# Altium schematic sheet TFT_Display_Sheet.SchDoc
size 420 x 297 mm; SheetNumber: 6; SheetTotal: 9
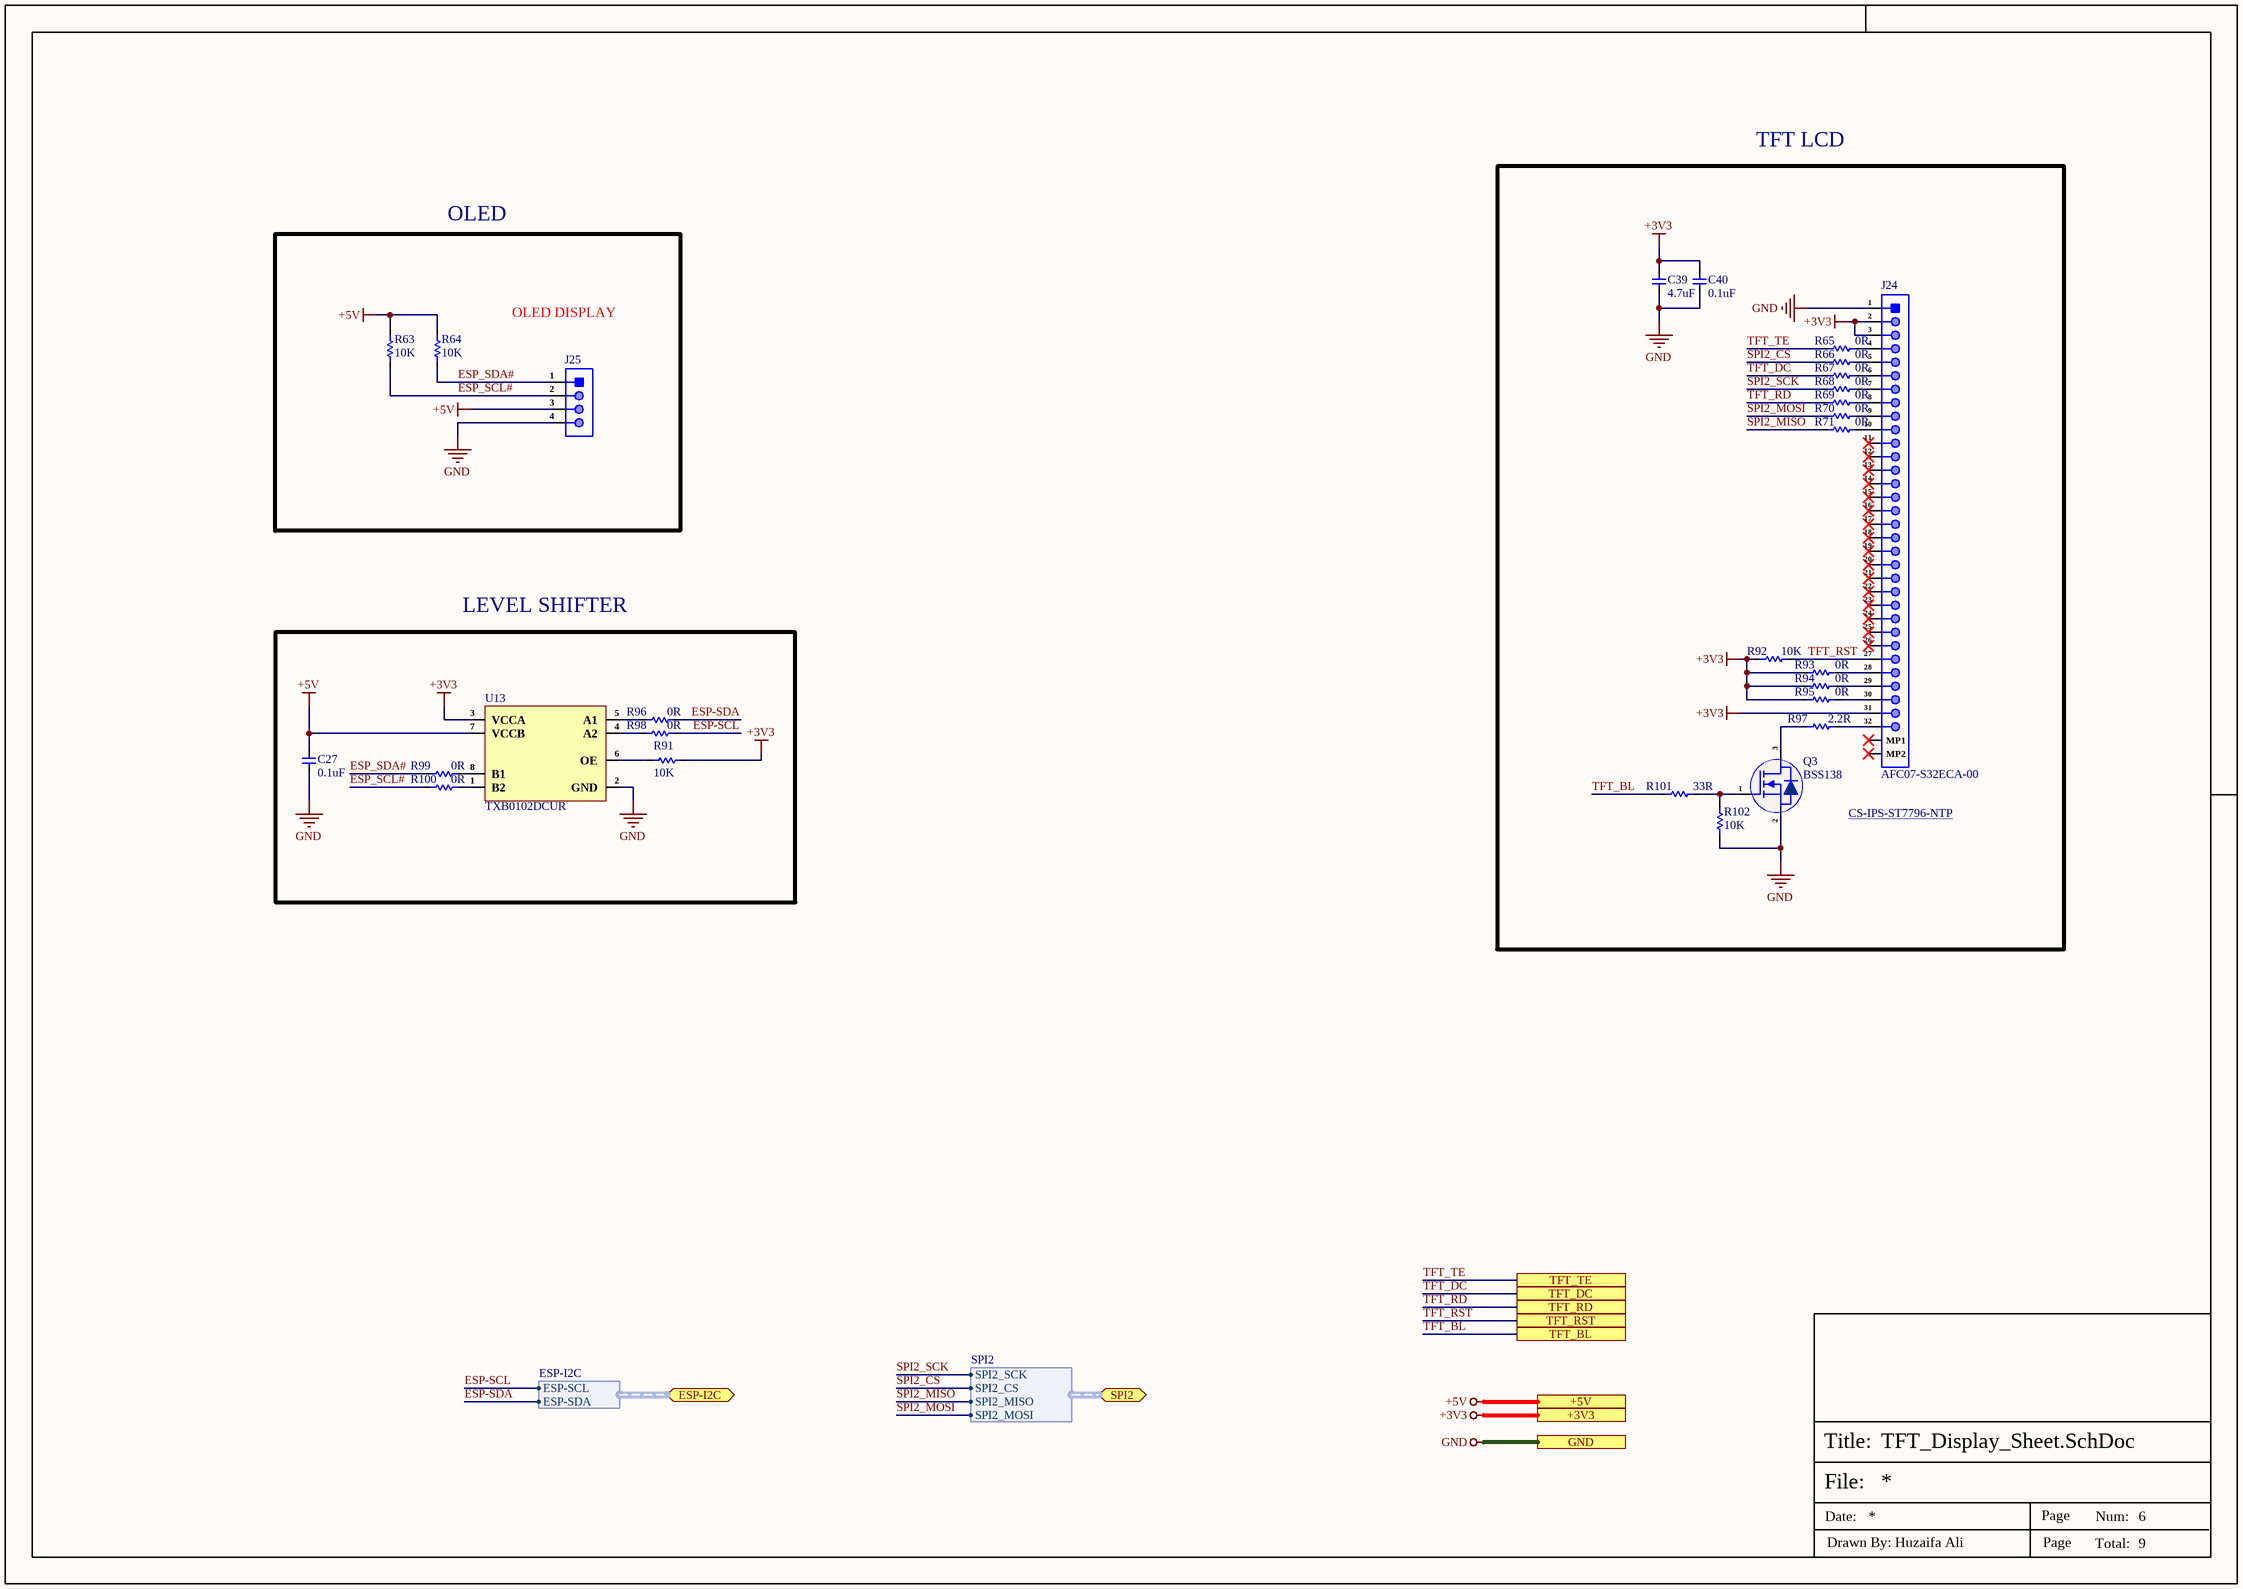
[diagram p0: TFT_Display_Sheet.SchDoc]

## Parts
C27  0.1uF  [Cap-0402]
C39  4.7uF  [Cap-0603]
C40  0.1uF  [Cap-0402]
J24  AFC07-S32ECA-00  [AFC07-S32ECA-00]
J25  B4B-XH-A(LF)(SN)  [B4B-XH-A(LF)(SN).]  (value not drawn)
Q3  BSS138  [Sot-23]
R63  10K  [Res-0402]
R64  10K  [Res-0402]
R65  0R  [Res-0402]
R66  0R  [Res-0402]
R67  0R  [Res-0402]
R68  0R  [Res-0402]
R69  0R  [Res-0402]
R70  0R  [Res-0402]
R71  0R  [Res-0402]
R91  10K  [Res-0402]
R92  10K  [Res-0402]
R93  0R  [Res-0402]
R94  0R  [Res-0402]
R95  0R  [Res-0402]
R96  0R  [Res-0402]
R97  2.2R  [Res-0603]
R98  0R  [Res-0402]
R99  0R  [Res-0402]
R100  0R  [Res-0402]
R101  33R  [Res-0402]
R102  10K  [Res-0402]
U13  TXB0102DCUR  [VSSOP-8(3.1x2.1)]

## Blocks framed on the sheet
CS-IPS-ST7796-NTP: C39 C40 J24 Q3 R65-R71 R92-R95 R97 R101 R102
OLED DISPLAY: J25 R63 R64

## Ports
+3V3 (see Top-Sheet[2B], CAN_Sheet[5D], ESP32_Sheet[5D], EtherCAT_Sheet[5D], Ethernet_Sheet[5D], Power_Sheet[5D], RS485_RS232_Sheet[5D], STM32_Sheet[5D]), +5V (see Top-Sheet[2B], CAN_Sheet[5D], Power_Sheet[5D], STM32_Sheet[5D]), ESP-I2C (bidir, harness ESP-I2C, see Top-Sheet[2B], ESP32_Sheet[4D]), GND (see Top-Sheet[2B], CAN_Sheet[5D], ESP32_Sheet[5D], EtherCAT_Sheet[5D], Ethernet_Sheet[5D], Power_Sheet[5D], RS485_RS232_Sheet[5D], STM32_Sheet[5D]), SPI2 (bidir, harness SPI2, see Top-Sheet[2B], STM32_Sheet[1C]), TFT_BL (see Top-Sheet[2C], STM32_Sheet[3D]), TFT_DC (see Top-Sheet[2C], STM32_Sheet[4D]), TFT_RD (see Top-Sheet[2C], STM32_Sheet[4D]), TFT_RST (see Top-Sheet[2C], STM32_Sheet[4D]), TFT_TE (see Top-Sheet[2B], STM32_Sheet[4D])

## Harnesses
ESP-I2C: ESP-SCL, ESP-SDA
SPI2: SPI2_SCK, SPI2_CS, SPI2_MISO, SPI2_MOSI

## Nets
+3V3: C39.2 C40.2 J24.2 J24.3 J24.31 R91.2 R92.2 R93.1 R94.1 R95.1 U13.3(VCCA) ; port +3V3
+5V: C27.2 J25.3 R63.2 R64.2 U13.7(VCCB) ; port +5V
GND: C27.1 C39.1 C40.1 J24.1 J25.4 Q3.2(S) R102.2 U13.2(GND) ; port GND
ESP-SCL: R98.2 ; port ESP-I2C.ESP-SCL
ESP-SDA: R96.2 ; port ESP-I2C.ESP-SDA
ESP_SCL#: J25.2 R63.1 R100.1
ESP_SDA#: J25.1 R64.1 R99.1
SPI2_CS: R66.1 ; port SPI2.SPI2_CS
SPI2_MISO: R71.1 ; port SPI2.SPI2_MISO
SPI2_MOSI: R70.1 ; port SPI2.SPI2_MOSI
SPI2_SCK: R68.1 ; port SPI2.SPI2_SCK
TFT_BL: R101.1 ; port TFT_BL
TFT_DC: R67.1 ; port TFT_DC
TFT_RD: R69.1 ; port TFT_RD
TFT_RST: J24.27 R92.1 ; port TFT_RST
TFT_TE: R65.1 ; port TFT_TE
NetJ24_4: J24.4 R65.2
NetJ24_5: J24.5 R66.2
NetJ24_6: J24.6 R67.2
NetJ24_7: J24.7 R68.2
NetJ24_8: J24.8 R69.2
NetJ24_9: J24.9 R70.2
NetJ24_10: J24.10 R71.2
NetJ24_28: J24.28 R93.2
NetJ24_29: J24.29 R94.2
NetJ24_30: J24.30 R95.2
NetJ24_32: J24.32 R97.2
NetQ3_1: Q3.1(G) R101.2 R102.1
NetQ3_3: Q3.3(D) R97.1
NetR91_1: R91.1 U13.6(OE)
NetR96_1: R96.1 U13.5(A1)
NetR98_1: R98.1 U13.4(A2)
NetR99_2: R99.2 U13.8(B1)
NetR100_2: R100.2 U13.1(B2)

Not connected (* = marked no-connect by the designer): J24 11* 12* 13* 14* 15* 16* 17* 18* 19* 20* 21* 22* 23* 24* 25* 26* MP1* MP2*

## Notes on the sheet
- TFT LCD
- OLED
- LEVEL SHIFTER
- File:
- Title:
- Date:
- Page
- Num:
- Total:
- Drawn By: Huzaifa Ali

## Library data of the parts
C27 = C1005X5R1H104K050BB: CAP CER 0.1UF 50V X5R 0402; Manufacturer: TDK; Dielectric Material: Ceramic; Capacitance: 100nF; Tolerance: 10%; Item Type: Capacitor; Supplier 1: Digi-Key; Manufacturer Part Number: C1005X5R1H104K050BB; Stock 1: 1455182; Pricing 1: 1=0.12, 10=0.09, 50=0.049, 100=0.04, 500=0.02858, 1000=0.02245, 2500=0.02041, 5000=0.01878 (USD); Mount: Surface Mount; Case/Package: 0402; Case Code (Metric): 1005; Case Code (Imperial): 0402; Weight: 2.3E-05oz; Min Operating Temperature: -55°C; Max Operating Temperature: 85°C; Dielectric: X5R; Voltage Rating: 50V; Packaging: Tape and Reel; Voltage Rating (DC): 50V; Termination: SMD/SMT; Construction: Flat; Package Quantity: 1; Resistor Type: Ceramic; Voltage: 50V; Series: C; Length: 1mm; Width: 0.02inch; Height: 0.5mm; Depth: 0.5mm; Thickness: 0.022inch; Radiation Hardening: No; Lead Free: Lead Free; REACH SVHC: No SVHC; RoHS Compliant: Yes; ComponentLink1URL: https://product.tdk.com/info/en/catalog/spec/mlccspec_commercial_general_midvoltage_en.pdf?src-supplier=Digi-Key; ComponentLink1Description: https://product.tdk.com/info/en/catalog/spec/mlccspec_commercial_general_midvoltage_en.pdf?src-supplier=Digi-Key; ComponentLink2URL: http://www.tdk.co.jp/tefe02/e413_c.pdf?src-supplier=Future+Electronics; ComponentLink2Description: http://www.tdk.co.jp/tefe02/e413_c.pdf?src-supplier=Future+Electronics; ComponentLink3URL: https://www.verical.com/server-webapp/html/getDatasheet?partID=743571&src-supplier=Verical; ComponentLink3Description: https://www.verical.com/server-webapp/html/getDatasheet?partID=743571&src-supplier=Verical; ComponentLink4URL: http://www.tdk.co.jp/tefe02/e412_c.pdf?src-supplier=Avnet+Europe; ComponentLink4Description: http://www.tdk.co.jp/tefe02/e412_c.pdf?src-supplier=Avnet+Europe; Supplier Part Number 1: 445-5942-1-ND; LCSC Part Number: C2181865
C39 = CC0603KRX5R7BB475: CAP CER 4.7UF 16V X5R 0603; Manufacturer: Yageo; Tolerance: 10%; Item Type: Capacitor; Supplier 1: Digi-Key; Manufacturer Part Number: CC0603KRX5R7BB475; RoHS: Yes; Category: Ceramic Capacitors; Stock 1: 547703; Pricing 1: 1=0.20000, 10=0.13800, 50=0.08280, 100=0.06990, 500=0.04784, 1000=0.04233 (USD); Mount: Surface Mount; Case/Package: 0603; Case Code (Imperial): 0603; Case Code (Metric): 1608; Weight: 7.1E-05oz; Min Operating Temperature: -55°C; Max Operating Temperature: 85°C; Capacitance: 4.7uF; Voltage Rating: 16V; Voltage Rating (DC): 16V; Packaging: Tape and Reel; Dielectric: X5R; Termination: SMD/SMT; Resistor Type: Ceramic; Series: CC; Length: 1.6mm; Width: 0.8mm; Height: 0.8mm; Thickness: 0.037inch; Depth: 0.8mm; Lead Free: Lead Free; Halogen Free: Halogen Free; RoHS Compliant: Yes; ComponentLink1URL: http://www.mouser.com/ds/2/447/UPY-GPHC_X5R_4V-to-50V_25-1131599.pdf?src-supplier=Mouser; ComponentLink1Description: http://www.mouser.com/ds/2/447/UPY-GPHC_X5R_4V-to-50V_25-1131599.pdf?src-supplier=Mouser; ComponentLink2URL: http://www.yageo.com/documents/recent/UPY-GPHC_X5R_4V-to-50V_25.pdf?src-supplier=Digi-Key; ComponentLink2Description: http://www.yageo.com/documents/recent/UPY-GPHC_X5R_4V-to-50V_25.pdf?src-supplier=Digi-Key; Supplier Part Number 1: 311-1785-1-ND; LCSC Part Number: C277476
C40 = CC0402JRX7R7BB104: CAP CER 0.1UF 16V X7R 0402; Manufacturer: Yageo; Material: 4241ConductorMaterial; Value: 100nF; Tolerance: 5%; Item Type: Capacitor; Supplier: Digikey; Supplier Part Number: 311-1676-1-ND; Manufacturer Part Number: CC0402JRX7R7BB104; RoHS: Yes; Category: Ceramic Capacitors; Stock: 1659111; Pricing: 1=0.1, 10=0.046, 50=0.0262, 100=0.0203, 500=0.01528, 1000=0.012, 2500=0.01091, 5000=0.01004 (USD); Mounting Technology: Surface Mount; Case/Package: 0402; Case Code (Metric): 1005; Case Code (Imperial): 0402; Min Operating Temperature: -55°C; Max Operating Temperature: 125°C; Dielectric: X7R; Packaging: Tape and Reel; Package Quantity: 10000; Voltage Rating (DC): 16V; Voltage Rating: 16V; Series: CC; Construction: Flat; Length: 0.039inch; Width: 0.02inch; Height: 0.5mm; Thickness: 0.022inch; Lead Free: Lead Free; Halogen Free: Halogen Free; RoHS Compliant: Yes; ComponentLink1URL: https://datasheet.ciiva.com/13210/upy-gphc-x7r-6-3v-to-50v-8-12304-13210152.pdf?src-supplier=Mouser; ComponentLink1Description: https://datasheet.ciiva.com/13210/upy-gphc-x7r-6-3v-to-50v-8-12304-13210152.pdf?src-supplier=Mouser; LCSC Part Number: C541464
J24 = AFC07-S32ECA-00: Slide Lock 32P Contact,Top Surface Mount，Right Angle 0.5mm SMD,P=0.5mm,Surface Mount，Right Angle FFC/FPC Connectors ROHS; Manufacturer: JUSHUO; Manufacturer Part Number: AFC07-S32ECA-00; Package: Custom; LCSC Part Number: C262646; Item Type: FFC/FPC Connector; ComponentLink1Description: LCSC; ComponentLink1URL: https://www.lcsc.com/product-detail/FFC-FPC-Connectors_JUSHUO-AFC07-S32ECA-00_C262646.html
J25 = B4B-XH-A(LF)(SN): CONN HEADER VERT 4POS 2.5MM; Manufacturer: JST; Current Rating: 3A; Gender: Male; Contact Resistance: 20mR; Voltage Rating (AC): 250V; Connector Type: Male Pin; Number of Positions: 4; Insulation Resistance: 1GR; Wire/Cable Gauge: 22AWG; Item Type: JST Connector; Supplier 1: Future Electronics; Manufacturer Part Number: B4B-XH-A(LF)(SN); RoHS: Yes; Category: FFC / FPC; Pricing 1: 1=0.13000, 300=0.11300, 1000=0.11000, 3000=0.10700, 10000=0.10400 (USD); Mount: Through Hole; Contact Material: Brass; Material: Polyamide; Contact Plating: Tin,Copper,Lead; Color: Natural; Housing Material: Polyamide; Housing Color: White; Min Operating Temperature: -25°C; Max Operating Temperature: 85°C; Number of Rows: 1; Max Current Rating: 3A; Package Quantity: 500; Packaging: Bulk; Voltage Rating: 250V; Termination: Press-Fit; Max Voltage Rating (AC): 250V; Max Voltage Rating (DC): 250V; Number of Contacts: 4; Orientation: Straight; Length: 12.4mm; Pitch: 2.5mm; Lead Pitch: 2.5mm; Depth: 5.75mm; REACH SVHC: No SVHC; Lead Free: Lead Free; ComponentLink1URL: https://datasheet.ciiva.com/26894/getdatasheetpartid-455616-26894787.pdf?src-supplier=Verical; ComponentLink1Description: https://datasheet.ciiva.com/26894/getdatasheetpartid-455616-26894787.pdf?src-supplier=Verical; ComponentLink2URL: https://datasheet.ciiva.com/26924/getdatasheetpartid-640571-26924035.pdf?src-supplier=Verical; ComponentLink2Description: https://datasheet.ciiva.com/26924/getdatasheetpartid-640571-26924035.pdf?src-supplier=Verical; ComponentLink3URL: https://datasheet.ciiva.com/16203/b4b-xh-alfsn-16203642.pdf?src-supplier=Future+Electronics; ComponentLink3Description: https://datasheet.ciiva.com/16203/b4b-xh-alfsn-16203642.pdf?src-supplier=Future+Electronics; ComponentLink4URL: https://datasheet.ciiva.com/726/exh-726404.pdf?src-supplier=Digi-Key; ComponentLink4Description: https://datasheet.ciiva.com/726/exh-726404.pdf?src-supplier=Digi-Key; Supplier Part Number 1: 8134090; LCSC Part Number: C144395
Q3 = BSS138: 50V 220mA 3.5Ω@10V,220mA 225mW 1.6V@1mA N Channel SOT-23 MOSFETs ROHS; Manufacturer: Slkor(SLKORMICRO Elec.); Item Type: Mosfet; Manufacturer Part Number: BSS138; Package: SOT-23; LCSC Part Number: C426569; ComponentLink1Description: LCSC; ComponentLink1URL: https://www.lcsc.com/product-detail/MOSFETs_Slkor-SLKORMICRO-Elec-BSS138_C426569.html
R63 R64 R91 R92 R102 = RC0402FR-0710KL: RES 10K OHM 1% 1/16W 0402; Manufacturer: Yageo; Resistance: 10kR; Voltage Rating (DC): 50V; Temperature Coefficient: 100ppm/°C; Power Rating: 62.5mW; Max Power Dissipation: 63mW; Item Type: Resistor; Supplier 1: Mouser; Manufacturer Part Number: RC0402FR-0710KL; RoHS: Yes; Category: Chip SMD Resistors; Stock 1: 18648329; Pricing 1: 1=0.10000, 10=0.01400, 50=0.01400, 100=0.00500, 1000=0.00300, 10000=0.00200 (USD); Case/Package: 0402; Number of Pins: 2; Case Code (Imperial): 0402; Case Code (Metric): 1005; Min Operating Temperature: -55°C; Max Operating Temperature: 155°C; Resistor Type: Thick Film; Tolerance: 1%; Packaging: Tape and Reel; Voltage Rating: 50V; Termination: SMD/SMT; Working Voltage: 50V; Number of Terminations: 2; Features: Moisture Resistant; Series: RC; Resistance Tolerance: 1%; Construction: Rectangular; Length: 1mm; Width: 0.5mm; Height: 0.32mm; Depth: 0.5mm; Lead Pitch: 0.2mm; REACH SVHC: No SVHC; Lead Free: Lead Free; RoHS Compliant: Yes; Military Standard: Not; ComponentLink1URL: https://datasheet.ciiva.com/7660/38568-7660787.pdf?src-supplier=Element14; ComponentLink1Description: https://datasheet.ciiva.com/7660/38568-7660787.pdf?src-supplier=Element14; ComponentLink2URL: https://datasheet.ciiva.com/7849/1686128-7849814.pdf?src-supplier=Element14; ComponentLink2Description: https://datasheet.ciiva.com/7849/1686128-7849814.pdf?src-supplier=Element14; ComponentLink3URL: https://datasheet.ciiva.com/7983/1018594-7983486.pdf?src-supplier=Element14; ComponentLink3Description: https://datasheet.ciiva.com/7983/1018594-7983486.pdf?src-supplier=Element14; ComponentLink4URL: https://datasheet.ciiva.com/22747/1018594-22747512.pdf?src-supplier=Element14; ComponentLink4Description: https://datasheet.ciiva.com/22747/1018594-22747512.pdf?src-supplier=Element14; ComponentLink5URL: https://datasheet.ciiva.com/12667/pyu-rc0402-51-rohs-l-6-r-12667067.pdf?src-supplier=Mouser; ComponentLink5Description: https://datasheet.ciiva.com/12667/pyu-rc0402-51-rohs-l-6-r-12667067.pdf?src-supplier=Mouser; ComponentLink6URL: https://datasheet.ciiva.com/7849/1784430-7849813.pdf?src-supplier=Element14; ComponentLink6Description: https://datasheet.ciiva.com/7849/1784430-7849813.pdf?src-supplier=Element14; ComponentLink7URL: https://datasheet.ciiva.com/7849/1784430-7849815.pdf?src-supplier=Element14; ComponentLink7Description: https://datasheet.ciiva.com/7849/1784430-7849815.pdf?src-supplier=Element14; Supplier Part Number 1: 603-RC0402FR-0710KL; LCSC Part Number: C60490
R65-R71 R93-R96 R98-R100 = RC0402FR-070RL: RES 0 OHM JUMPER 1/16W 0402; Manufacturer: Yageo; Item Type: Resistors; Tolerance: 1%; Power Rating: 62.5mW; Voltage Rating: 50V; Temperature Coefficient: 200ppm/°C; Max Power Dissipation: 63mW; Supplier 1: Mouser; Manufacturer Part Number: RC0402FR-070RL; RoHS: Yes; Stock 1: 8556842; Pricing 1: 1=0.10000, 10=0.01400, 50=0.01400, 100=0.00600, 1000=0.00300, 5000=0.00200, 10000=0.00100 (USD); Mount: Surface Mount; Case/Package: 0402; Contact Plating: Tin,Matte; Case Code (Imperial): 0402; Case Code (Metric): 1005; Size Code: 0402; Min Operating Temperature: -55°C; Max Operating Temperature: 155°C; Resistance: 0R; Resistor Type: Thick Film; Packaging: Tape and Reel; Termination: SMD/SMT; Features: Moisture Resistant; Series: RC; Number of Terminations: 2; Length: 1mm; Width: 0.5mm; Height: 0.35mm; Radiation Hardening: No; Lead Free: Lead Free; RoHS Compliant: Yes; ComponentLink1URL: https://datasheet.ciiva.com/8896/pyu-rc0402-51-rohs-l-6-8896149.pdf?src-supplier=Avnet; ComponentLink1Description: https://datasheet.ciiva.com/8896/pyu-rc0402-51-rohs-l-6-8896149.pdf?src-supplier=Avnet; ComponentLink2URL: https://datasheet.ciiva.com/16790/pyu-rc0402-51-rohs-l-6-r-16790444.pdf?src-supplier=Future+Electronics; ComponentLink2Description: https://datasheet.ciiva.com/16790/pyu-rc0402-51-rohs-l-6-r-16790444.pdf?src-supplier=Future+Electronics; Supplier Part Number 1: 603-RC0402FR-070RL; LCSC Part Number: C106231
R97 = RC0603FR-072R2L: RES 2.2 OHM 1% 1/10W 0603; Manufacturer: Yageo; Item Type: Resistors; Voltage Rating: 50V; Power Rating: 100mW; Temperature Coefficient: 200ppm/°C; Supplier: Digikey; LCSC Part Number: C112307; Manufacturer Part Number: RC0603FR-072R2L; RoHS: Yes; Stock: 331140; Pricing: 1=0.1, 10=0.029, 50=0.0188, 100=0.0158, 500=0.01094, 1000=0.00947 (USD); Case/Package: 0603; Pins: 2; Case Code (Metric): 1608; Case Code (Imperial): 0603; Min Operating Temperature: -55°C; Max Operating Temperature: 155°C; Voltage Rating (DC): 50V; Package Quantity: 1; Value: 2.2R; Tolerance: 1%; Packaging: Tape and Reel; Resistor Type: Thick Film; Number of Terminations: 2; Termination: SMD/SMT; Max Power Dissipation: 100mW; Features: Moisture Resistant; Series: RC; Technology: THICK FILM; Resistance Tolerance: 1%; Length: 0.063inch; Width: 0.031inch; Height: 0.022inch; Depth: 0.8mm; Reach SVHC Compliant: No; Lead Free: Lead Free; RoHS Compliant: Yes; ComponentLink1URL: https://datasheet.ciiva.com/11808/0900766b80f96399-11808160.pdf?src-supplier=Rs; ComponentLink1Description: https://datasheet.ciiva.com/11808/0900766b80f96399-11808160.pdf?src-supplier=Rs; ComponentLink2URL: https://datasheet.ciiva.com/2554/pyu-r-int-thick-7-2554421.pdf?src-supplier=Digikey; ComponentLink2Description: https://datasheet.ciiva.com/2554/pyu-r-int-thick-7-2554421.pdf?src-supplier=Digikey; ComponentLink3URL: https://datasheet.ciiva.com/2554/pyu-r-int-thick-7-2554422.pdf?src-supplier=Digikey; ComponentLink3Description: https://datasheet.ciiva.com/2554/pyu-r-int-thick-7-2554422.pdf?src-supplier=Digikey; ComponentLink4URL: https://datasheet.ciiva.com/2554/pyu-r-int-thick-7-2554420.pdf?src-supplier=Digikey; ComponentLink4Description: https://datasheet.ciiva.com/2554/pyu-r-int-thick-7-2554420.pdf?src-supplier=Digikey
R101 = RC0402FR-0733RL: RES 33 OHM 1% 1/16W 0402; Manufacturer: Yageo; Power Rating: 62.5mW; Voltage Rating: 50V; Temperature Coefficient: 100ppm/°C; Max Power Dissipation: 63mW; Supplier 1: Mouser; Manufacturer Part Number: RC0402FR-0733RL; RoHS: Yes; Category: Chip SMD Resistors; Stock 1: 1843488; Pricing 1: 1=0.10000, 10=0.01200, 50=0.01200, 100=0.00500, 1000=0.00300, 10000=0.00100 (USD); Case/Package: 0402; Number of Pins: 2; Case Code (Imperial): 0402; Case Code (Metric): 1005; Size Code: 0402; Min Operating Temperature: -55°C; Max Operating Temperature: 155°C; Resistor Type: Thick Film; Resistance: 33R; Tolerance: 1%; Packaging: Tape and Reel; Voltage Rating (DC): 50V; Package Quantity: 10000; Termination: SMD/SMT; Features: Moisture Resistant; Series: RC; Number of Terminations: 2; Resistance Tolerance: 1%; Construction: Rectangular; Technology: THICK FILM; Length: 1mm; Width: 0.5mm; Height: 0.35mm; Depth: 0.5mm; RoHS Compliant: Yes; REACH SVHC: Unknown; Military Standard: Not; Lead Free: Lead Free; ComponentLink1URL: https://datasheet.ciiva.com/11819/0900766b80c66297-11819487.pdf?src-supplier=RSComponents; ComponentLink1Description: https://datasheet.ciiva.com/11819/0900766b80c66297-11819487.pdf?src-supplier=RSComponents; ComponentLink2URL: https://datasheet.ciiva.com/24070/pyu-rc0402-51-rohs-l-6-r-8721-24070077.pdf?src-supplier=Mouser; ComponentLink2Description: https://datasheet.ciiva.com/24070/pyu-rc0402-51-rohs-l-6-r-8721-24070077.pdf?src-supplier=Mouser; ComponentLink3URL: https://datasheet.ciiva.com/7849/1018594-7849967.pdf?src-supplier=Element14; ComponentLink3Description: https://datasheet.ciiva.com/7849/1018594-7849967.pdf?src-supplier=Element14; ComponentLink4URL: https://datasheet.ciiva.com/7849/1018594-7849966.pdf?src-supplier=Element14; ComponentLink4Description: https://datasheet.ciiva.com/7849/1018594-7849966.pdf?src-supplier=Element14; ComponentLink5URL: https://datasheet.ciiva.com/15189/getdatasheetpartid-329253-15189431.pdf?src-supplier=Verical; ComponentLink5Description: https://datasheet.ciiva.com/15189/getdatasheetpartid-329253-15189431.pdf?src-supplier=Verical; ComponentLink6URL: https://datasheet.ciiva.com/17070/pyu-rc0402-51-rohs-l-6-r-17070335.pdf?src-supplier=Future+Electronics; ComponentLink6Description: https://datasheet.ciiva.com/17070/pyu-rc0402-51-rohs-l-6-r-17070335.pdf?src-supplier=Future+Electronics; Supplier Part Number 1: 603-RC0402FR-0733RL; LCSC Part Number: C138002
U13 = TXB0102DCUR: IC TRANSLTR BIDIRECTIONAL 8VSSOP; Manufacturer: Texas Instruments; Number of Circuits: 1; Nominal Supply Current: 3.5uA; Number of Inputs: 1NUMBER; Max Supply Voltage: 5.5V; Min Supply Voltage: 1.2V; Propagation Delay: 7.4ns; Data Rate: 100Mbps; Logic Function: Translator; Number of Bits: 2; Turn-On Delay Time: 31ns; High Level Output Current: -20uA; Low Level Output Current: 20uA; Output Type: 3-STATE; Supplier: Digikey; Supplier Part Number: 296-22862-1-ND; Manufacturer Part Number: TXB0102DCUR; RoHS: Yes; Category: Voltage Level Shifters; Stock: 10593; Pricing: 1=0.69, 10=0.606, 25=0.5696, 100=0.4649, 250=0.4318, 500=0.36748, 1000=0.29398 (USD); Mounting Technology: Surface Mount; Case/Package: VSSOP; Pins: 8; Weight: 0.000339oz; Min Operating Temperature: -40°C; Max Operating Temperature: 85°C; Number of Outputs: 1NUMBER; Packaging: Tape and Reel; Package Quantity: 3000; Series: -; Channel Type: Bidirectional; Length: 2.3mm; Width: 2mm; Height: 900um; Thickness: 850um; Radiation Hardening: No; Reach SVHC Compliant: No; Lead Free: Lead Free; RoHS Compliant: Yes; ComponentLink1URL: https://datasheet.ciiva.com/7744/1634161-7744195.pdf?src-supplier=Element14; ComponentLink1Description: https://datasheet.ciiva.com/7744/1634161-7744195.pdf?src-supplier=Element14; ComponentLink2URL: https://datasheet.ciiva.com/22677/1699360-22677930.pdf?src-supplier=Element14; ComponentLink2Description: https://datasheet.ciiva.com/22677/1699360-22677930.pdf?src-supplier=Element14; ComponentLink3URL: https://datasheet.ciiva.com/4226/sces641b-4226960.pdf?src-supplier=Arrow+Electronics; ComponentLink3Description: https://datasheet.ciiva.com/4226/sces641b-4226960.pdf?src-supplier=Arrow+Electronics; ComponentLink4URL: https://datasheet.ciiva.com/15096/getdatasheetpartid-214907-15096235.pdf?src-supplier=Verical; ComponentLink4Description: https://datasheet.ciiva.com/15096/getdatasheetpartid-214907-15096235.pdf?src-supplier=Verical; ComponentLink5URL: https://datasheet.ciiva.com/6132/txb0102-6132717.pdf?src-supplier=Farnell; ComponentLink5Description: https://datasheet.ciiva.com/6132/txb0102-6132717.pdf?src-supplier=Farnell; ComponentLink6URL: https://datasheet.ciiva.com/46384/1874809-46384198.pdf?src-supplier=Element14; ComponentLink6Description: https://datasheet.ciiva.com/46384/1874809-46384198.pdf?src-supplier=Element14; ComponentLink7URL: https://datasheet.ciiva.com/1899/txb0102-1899430.pdf?src-supplier=Digikey; ComponentLink7Description: https://datasheet.ciiva.com/1899/txb0102-1899430.pdf?src-supplier=Digikey; ComponentLink8URL: https://datasheet.ciiva.com/1899/txb0102-1899429.pdf?src-supplier=Digikey; ComponentLink8Description: https://datasheet.ciiva.com/1899/txb0102-1899429.pdf?src-supplier=Digikey; ComponentLink9URL: https://datasheet.ciiva.com/1899/txb0102-1899431.pdf?src-supplier=Digikey; ComponentLink9Description: https://datasheet.ciiva.com/1899/txb0102-1899431.pdf?src-supplier=Digikey; ComponentLink10URL: https://datasheet.ciiva.com/14287/txb0102-14287496.pdf?src-supplier=Avnet; ComponentLink10Description: https://datasheet.ciiva.com/14287/txb0102-14287496.pdf?src-supplier=Avnet; LCSC Part Number: C60709; Type: IC; ComponentLink11Description: LCSC; ComponentLink11URL: https://www.lcsc.com/product-detail/Translators-Level-Shifters_Texas-Instruments-TXB0102DCUR_C60709.html